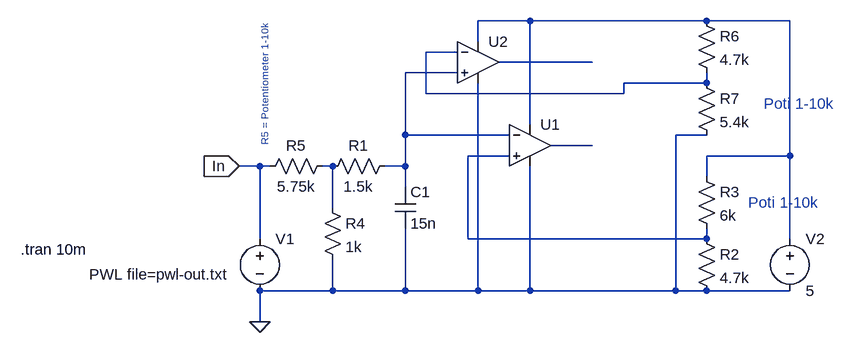
[diagram p0: schematic Konverter_ganzneu.asc]
Konverter_ganzneu.asc, the LTspice schematic file:
Version 4
SHEET 1 1720 680
WIRE 512 -688 432 -688
WIRE 784 -688 512 -688
WIRE 912 -688 784 -688
WIRE 432 -656 432 -688
WIRE 400 -640 352 -640
WIRE 608 -624 464 -624
WIRE 400 -608 320 -608
WIRE 784 -592 784 -608
WIRE 784 -592 656 -592
WIRE 352 -576 352 -640
WIRE 656 -576 656 -592
WIRE 656 -576 352 -576
WIRE 512 -528 512 -688
WIRE 320 -512 320 -608
WIRE 480 -512 320 -512
WIRE 784 -512 736 -512
WIRE 608 -496 544 -496
WIRE 480 -480 416 -480
WIRE 912 -480 912 -688
WIRE 912 -480 784 -480
WIRE 96 -464 64 -464
WIRE 112 -464 96 -464
WIRE 208 -464 192 -464
WIRE 320 -464 320 -512
WIRE 320 -464 288 -464
WIRE 784 -448 784 -480
WIRE 320 -432 320 -464
WIRE 208 -400 208 -464
WIRE 96 -352 96 -464
WIRE 416 -352 416 -480
WIRE 784 -352 784 -368
WIRE 784 -352 416 -352
WIRE 912 -352 912 -480
WIRE 208 -272 208 -320
WIRE 208 -272 96 -272
WIRE 320 -272 320 -368
WIRE 320 -272 208 -272
WIRE 432 -272 432 -592
WIRE 432 -272 320 -272
WIRE 512 -272 512 -464
WIRE 512 -272 432 -272
WIRE 736 -272 736 -512
WIRE 736 -272 512 -272
WIRE 784 -272 736 -272
WIRE 912 -272 784 -272
WIRE 96 -224 96 -272
FLAG 96 -224 0
FLAG 64 -464 In
IOPIN 64 -464 In
SYMBOL voltage 96 -368 R0
WINDOW 3 -263 71 Left 2
WINDOW 123 24 44 Left 2
WINDOW 39 24 44 Left 2
SYMATTR Value PWL file=pwl-out.txt
SYMATTR InstName V1
SYMBOL res 304 -480 R90
WINDOW 0 0 56 VBottom 2
WINDOW 3 32 56 VTop 2
SYMATTR InstName R1
SYMATTR Value 1.5k
SYMATTR SpiceLine tol=5
SYMBOL cap 304 -432 R0
SYMATTR InstName C1
SYMATTR Value 15n
SYMATTR SpiceLine V=25 Irms=728m Rser=0.14361 Lser=0
SYMBOL res 192 -416 R0
SYMATTR InstName R4
SYMATTR Value 1k
SYMBOL res 208 -480 R90
WINDOW 0 0 56 VBottom 2
WINDOW 3 32 56 VTop 2
SYMATTR InstName R5
SYMATTR Value 5.75k
SYMBOL voltage 912 -368 R0
WINDOW 123 0 0 Left 0
WINDOW 39 0 0 Left 0
SYMATTR InstName V2
SYMATTR Value 5
SYMBOL res 768 -368 R0
SYMATTR InstName R2
SYMATTR Value 4.7k
SYMBOL res 768 -464 R0
SYMATTR InstName R3
SYMATTR Value 6k
SYMBOL res 768 -704 R0
SYMATTR InstName R6
SYMATTR Value 4.7k
SYMBOL res 768 -608 R0
SYMATTR InstName R7
SYMATTR Value 5.4k
SYMBOL Opamps\\UniversalOpamp2 512 -496 R0
SYMATTR InstName U1
SYMBOL Opamps\\UniversalOpamp2 432 -624 R0
SYMATTR InstName U2
TEXT -272 -336 Left 2 !.tran 10m
TEXT 104 -496 VLeft 1 ;R5 = Potentiometer 1-10k
TEXT 872 -560 Left 2 ;Poti 1-10k
TEXT 848 -408 Left 2 ;Poti 1-10k

The netlist it stands for:
* Konverter_ganzneu.asc
V1 In 0 PWL file=pwl-out.txt
R1 N004 N007 1.5k tol=5
C1 N004 0 15n V=25 Irms=728m Rser=0.14361 Lser=0
R4 N007 0 1k
R5 N007 In 5.75k
V2 N001 0 5
R2 N006 0 4.7k
R3 N001 N006 6k
R6 N001 N002 4.7k
R7 N002 0 5.4k
XU1 N006 N004 N001 0 N005 level.2 Avol=1Meg GBW=10Meg Slew=10Meg ilimit=25m rail=0 Vos=0 phimargin=45 en=0 enk=0 in=0 ink=0 Rin=500Meg  ; pins IN+ IN- V+ V- OUT
XU2 N004 N002 N001 0 N003 level.2 Avol=1Meg GBW=10Meg Slew=10Meg ilimit=25m rail=0 Vos=0 phimargin=45 en=0 enk=0 in=0 ink=0 Rin=500Meg  ; pins IN+ IN- V+ V- OUT
.tran 10m
* R5 = Potentiometer 1-10k
* Poti 1-10k
* Poti 1-10k
.lib UniversalOpamps2.sub
.backanno
.end